# EAGLE design PWM Driver V2.2 (EAGLE 9.6.2)
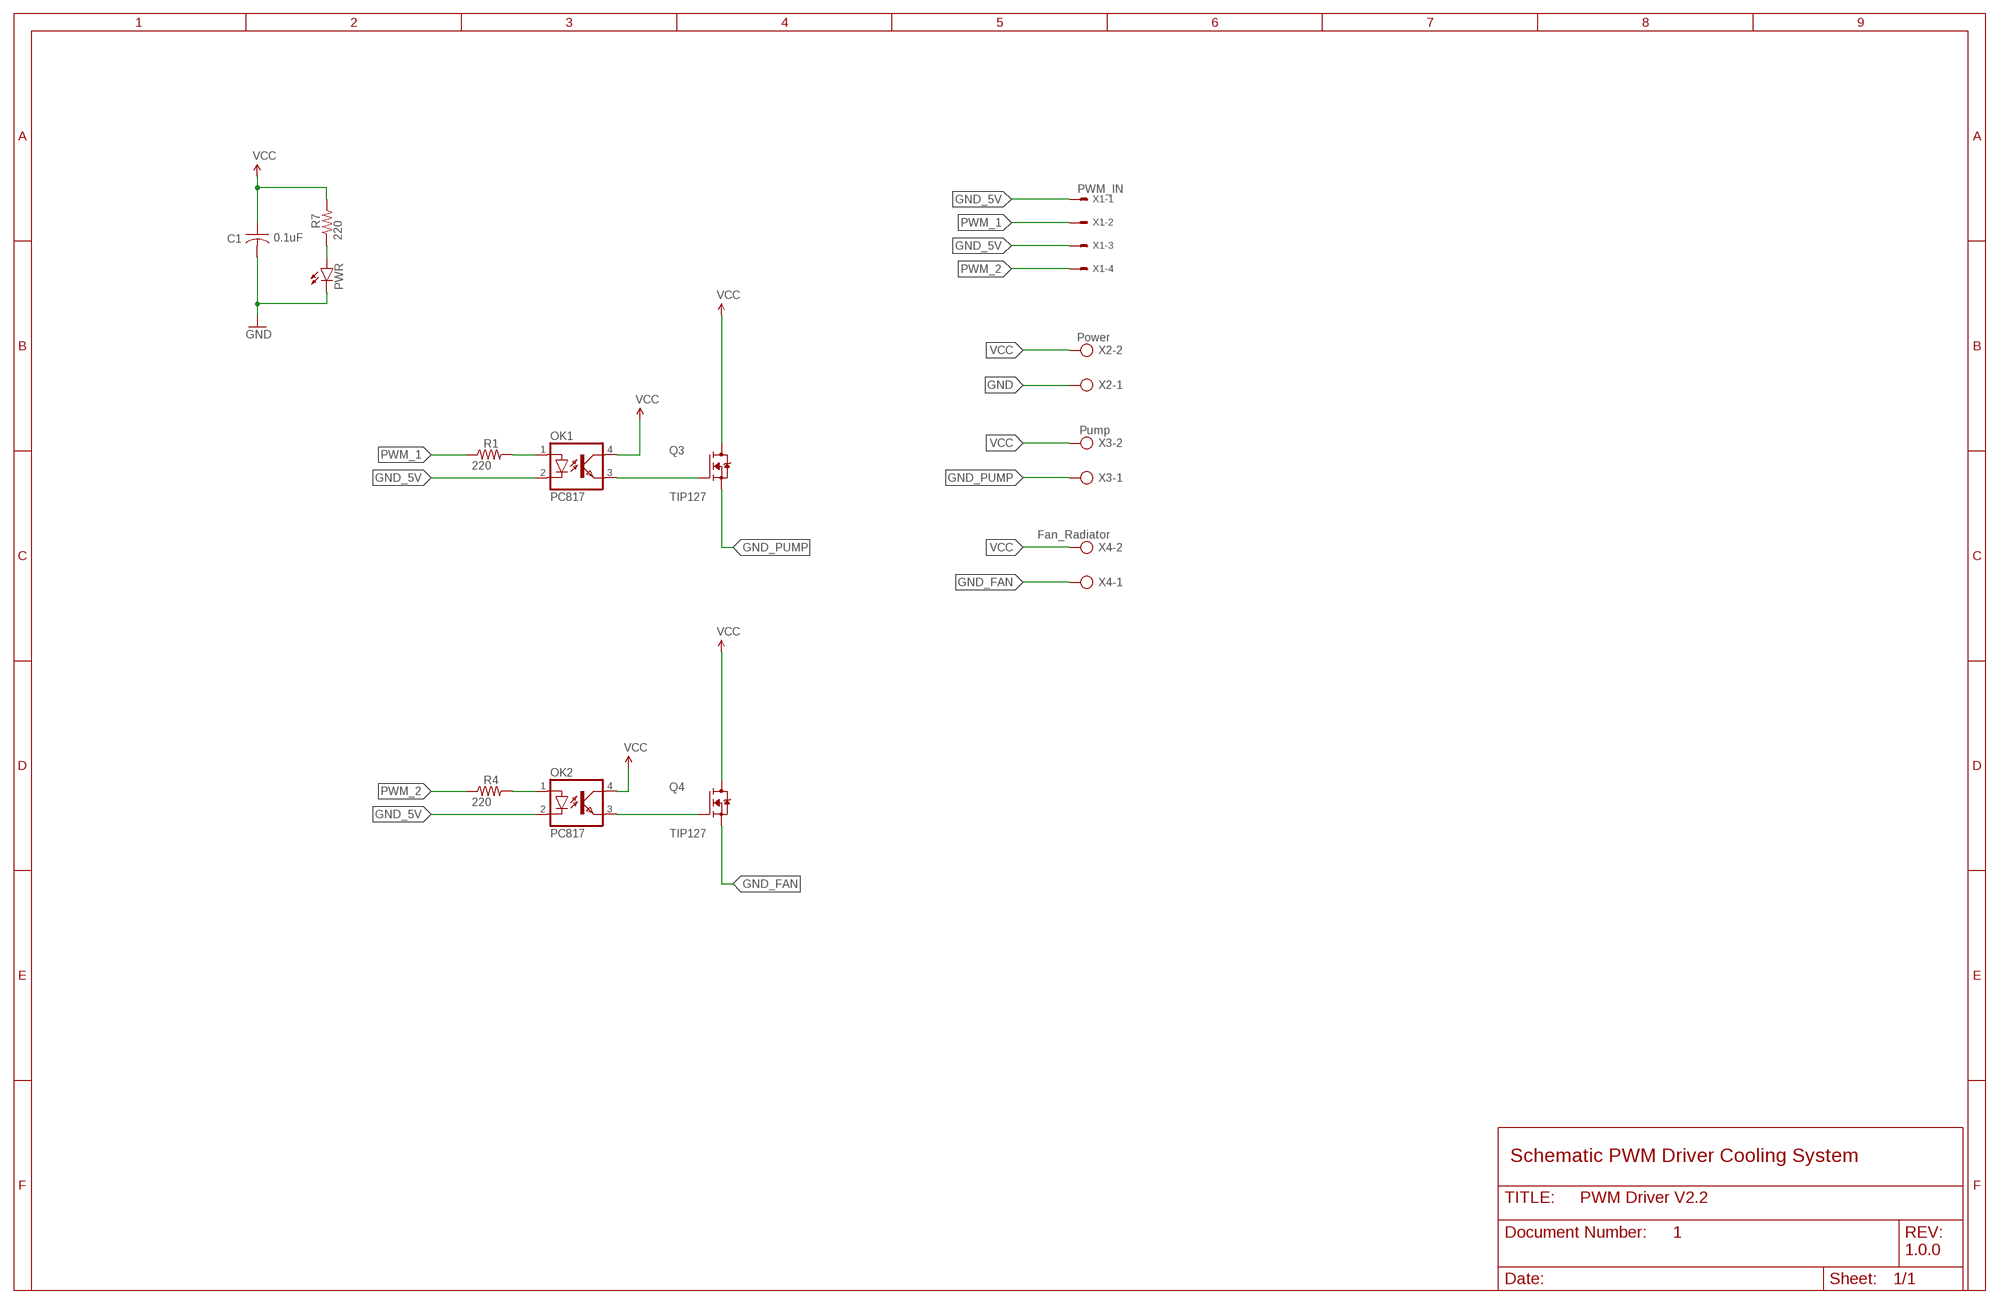
[diagram p0: schematic, sheet 1]
FRAME1 (FRAME_B_L): DESIGNER: PRATIK MAKWANA; DOC: 1; REV: 1.0.0

## Parts
C1  0.1uF  C-US050-030X075  [C050-030X075]
OK1  PC817  [DIL04]
OK2  PC817  [DIL04]
PWR  LED5MM  [LED5MM]
Q3  TIP127  IRF3205  [TO254P1041X444X2933-3]
Q4  TIP127  IRF3205  [TO254P1041X444X2933-3]
R1  220  R-US_0207/10  [0207/10]
R4  220  R-US_0207/10  [0207/10]
R7  220  R-US_0207/10  [0207/10]
X1  PWM_IN  22-23-2041  [22-23-2041]
X2  Power  AK500/2  [AK500/2]
X3  Pump  AK500/2  [AK500/2]
X4  Fan_Radiator  AK500/2  [AK500/2]

## Nets
GND: C1.2 PWR.K(C) X2.1
GND_5V: OK1.2(C) OK2.2(C) X1.1 X1.3
GND_FAN: Q4.3(S) X4.1
GND_PUMP: Q3.3(S) X3.1
N$1: OK2.1(A) R4.2
N$2: OK1.1(A) R1.2
N$3: OK2.3(EMIT) Q4.1(G)
N$4: OK1.3(EMIT) Q3.1(G)
N$6: PWR.A R7.1
PWM_1: R1.1 X1.2
PWM_2: R4.1 X1.4
VCC: C1.1 OK1.4(COL) OK2.4(COL) Q3.2(D) Q4.2(D) R7.2 X2.2 X3.2 X4.2

## Notes on the sheet
- Schematic PWM Driver Cooling System

## Library data of the parts
C1 = adafruit:C-US: CAPACITOR, American symbol
OK1 OK2 = optocoupler:PC817: SHARP OPTO COUPLER; MPN: PC817X4J000F; OC_FARNELL: 9707727; OC_NEWARK: 97K7059
PWR = led:LED: LED OSRAM: - CHIPLED LG R971, LG N971, LY N971, LG Q971, LY Q971, LO R971, LY R971 LH N974, LH R974 LS Q976, LO Q976, LY Q976 LO Q996 - Hyper CHIPLED LW Q18S LB Q993, LB Q99A, LB R99A - SideLED LS A670, LO A670, LY A670, LG A670, LP A670 LB A673, LV A673, LT A673, LW A673 LH A674 LY A675 LS A676, LA A676, LO A676, LY A676, LW A676 LS A679, LY A679, LG A679 - Hyper Micro SIDELED® LS Y876, LA Y876, LO Y876, LY Y876 LT Y87S - SmartLED LW L88C, LW L88S LB L89C, LB L89S, LG L890 LS L89K, LO L89K, LY L89K LS L896, LA L896, LO L896, LY L896 - TOPLED LS T670, LO T670, LY T670, LG T670, LP T670 LSG T670, LSP T670, LSY T670, LOP T670, LYG T670 LG T671, LOG T671, LSG T671 LB T673, LV T673, LT T673, LW T673 LH T674 LS T676, LA T676, LO T676, LY T676, LB T676, LH T676, LSB T676, LW T676 LB T67C, LV T67C, LT T67C, LS T67K, LO T67K, LY T67K, LW E67C LS E67B, LA E67B, LO E67B, LY E67B, LB E67C, LV E67C, LT E67C LW T67C LS T679, LY T679, LG T679 LS T770, LO T770, LY T770, LG T770, LP T770 LB T773, LV T773, LT T773, LW T773 LH T774 LS E675, LA E675, LY E675, LS T675 LS T776, LA T776, LO T776, LY T776, LB T776 LHGB T686 LT T68C, LB T68C - Hyper Mini TOPLED® LB M676 - Mini TOPLED Santana® LG M470 LS M47K, LO M47K, LY M47K Source: http://www.osram.convergy.de LUXEON: - LUMILED® LXK2-PW12-R00, LXK2-PW12-S00, LXK2-PW14-U00, LXK2-PW14-V00 LXK2-PM12-R00, LXK2-PM12-S00, LXK2-PM14-U00 LXK2-PE12-Q00, LXK2-PE12-R00, LXK2-PE12-S00, LXK2-PE14-T00, LXK2-PE14-U00 LXK2-PB12-K00, LXK2-PB12-L00, LXK2-PB12-M00, LXK2-PB14-N00, LXK2-PB14-P00, LXK2-PB14-Q00 LXK2-PR12-L00, LXK2-PR12-M00, LXK2-PR14-Q00, LXK2-PR14-R00 LXK2-PD12-Q00, LXK2-PD12-R00, LXK2-PD12-S00 LXK2-PH12-R00, LXK2-PH12-S00 LXK2-PL12-P00, LXK2-PL12-Q00, LXK2-PL12-R00 Source: www.luxeon.com KINGBRIGHT: KA-3528ASYC Source: www.kingbright.com
Q3 Q4 = IRF3205:IRF3205: N-Channel 55V 75A (Tc) 170W (Tc) Through Hole TO-220AB Check availability <https://pricing.snapeda.com/parts/IRF3205/Infineon%20Technologies/view-part?ref=eda>; AVAILABILITY: In Stock; CHECK_PRICES: https://www.snapeda.com/parts/IRF3205/Infineon/view-part/?ref=eda; DESCRIPTION: N-Channel 55V 110A (Tc) 200W (Tc) Through Hole TO-220AB; MF: Infineon Technologies; MP: IRF3205; PACKAGE: TO-220 Infineon; PRICE: None; SNAPEDA_LINK: https://www.snapeda.com/parts/IRF3205/Infineon/view-part/?ref=snap
R1 R4 R7 = adafruit:R-US_: RESISTOR, American symbol
X1 = con-molex:22-23-2041: .100" (2.54mm) Center Header - 4 Pin; MF: MOLEX; MPN: 22-23-2041; OC_FARNELL: 1462920; OC_NEWARK: 38C0355
X2-X4 = con-ptr500:AK500/2: CONNECTOR; OC_FARNELL: unknown; OC_NEWARK: unknown

## Board
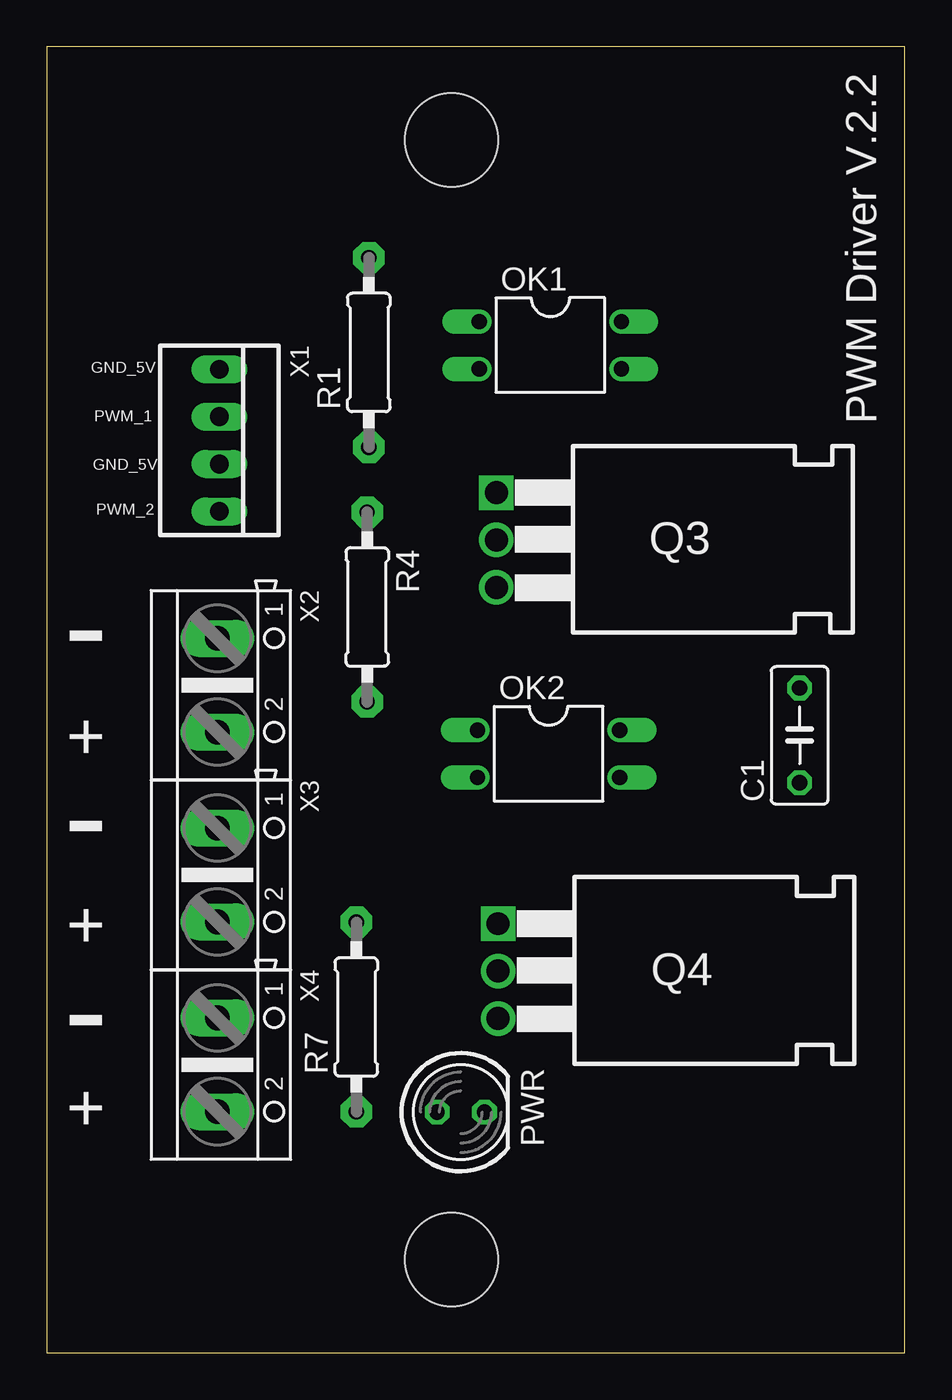
[diagram p1: board, top side]
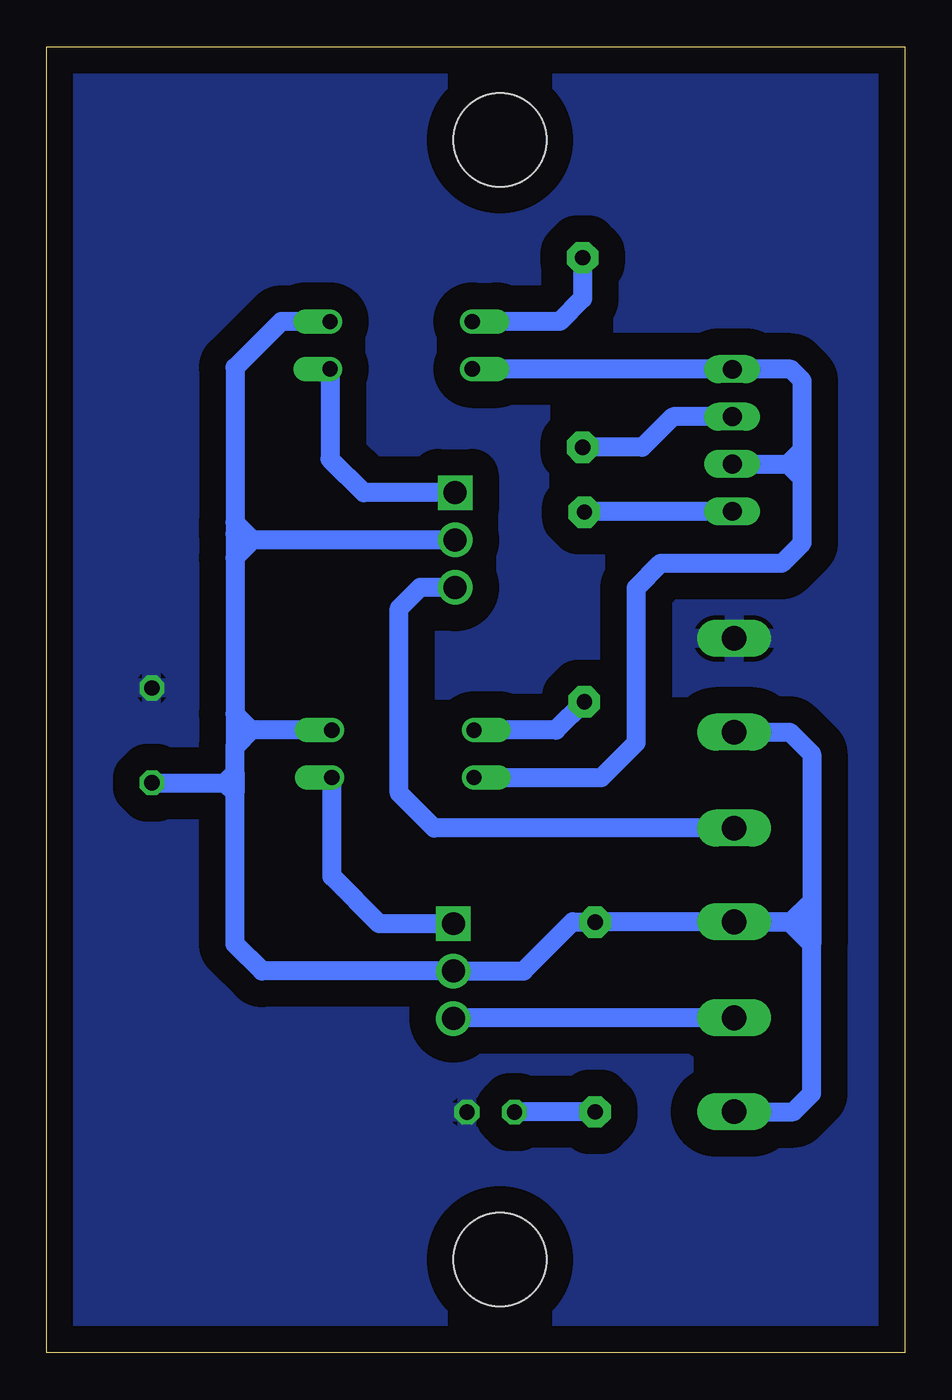
[diagram p2: board, bottom side, seen from below]

Size 46 x 70 mm. Coordinates in mm from the lower left corner, seen from the top.
Outline: 0,0 46,0 46,70 0,70 0,0
Copper layers (1*16): Top 0.035mm / dielectric 1.5mm / Bottom 0.035mm
Design rules "default": minimum track width 6mil, minimum drill 0.35mm, track to track 6mil, track to pad 6mil, pad to pad 6mil, via to via 6mil, smd to smd 6mil, copper to edge 40mil, drill to drill 6mil, minimum pad ring 10mil, minimum via ring 8mil, stop-mask expansion 4mil, vias tented up to drill 0mil, thermal gap 10mil
Holes 5 mm at 21.7,65 21.7,5

### Footprints (pad centres in the part's own frame; a part is rotated, then mirrored left to right if it is on the bottom)
C050-030X075 = drill 0.813 octagon: 1 -2.54,0; 2 2.54,0
DIL04 = drill 0.813 offset: 1 -1.27,-3.81; 2 1.27,-3.81; 3 1.27,3.81; 4 -1.27,3.81
LED5MM = drill 0.813 octagon: A -1.27,0; K 1.27,0
TO254P1041X444X2933-3 = drill 1.23 pad 1.85 square: 1 2.5,-4.2 | drill 1.23 pad 1.85: 2 5.04,-4.2; 3 7.58,-4.2
0207/10 = drill 0.813 pad 1.676 octagon: 1 -5.08,0; 2 5.08,0
22-23-2041 = drill 1 long: 1 -3.81,0; 2 -1.27,0; 3 1.27,0; 4 3.81,0
AK500/2 = drill 1.321 long: 1 -2.515,0; 2 2.515,0

### Placement (x,y rotation side)
C1  40.36,33.09 90 top
OK1  27,54 270 top
OK2  26.9,32.1 270 top
PWR  22.2,12.9 0 top
Q3  28.3,48.6 270 top
Q4  28.4,25.5 270 top
R1  17.27,53.61 90 top
R4  17.18,39.97 270 top
R7  16.6,18 90 top
X1  9.25,48.9 270 top
X2  9.15,35.78 270 top
X3  9.15,25.61 270 top
X4  9.15,15.44 270 top

### Tracks (layer width: path | path; a pad name or v marks a point on that pad's centre or on a via)
GND
  pour Bottom (isolate 1.422): 0,70 46,70 46,0 0,0
GND_5V
  Bottom 1.016: X1.3 6.27,47.63 | 5.5,48.4 6.27,47.63 | 5.5,48.4 5.5,52.1 6.11,52.71 X1.1 23.17,52.71 OK1.2 | 5.5,46.86 5.5,43.4 6.6,42.3 13.1,42.3 14.4,41 14.4,32.7 16.27,30.83 OK2.2 | 5.5,46.86 5.5,48.4 | 6.27,47.63 5.5,46.86
GND_FAN
  Bottom 1.016: X4.1 24.16,17.95 Q4.3
GND_PUMP
  Bottom 1.016: Q3.3 25.98,41.02 27.1,39.9 27.1,30 25.23,28.12 X3.1
N$1
  Bottom 1.016: R4.2 18.7,33.37 OK2.1
N$2
  Bottom 1.016: R1.2 17.27,56.49 18.49,55.27 OK1.1
N$3
  Bottom 1.016: Q4.1 28.18,23 30.71,25.53 OK2.3
N$4
  Bottom 1.016: Q3.1 29,46.1 30.81,47.91 OK1.3
N$6
  Bottom 1.016: R7.1 20.91,12.92 PWR.A
PWM_1
  Bottom 1.016: R1.1 14.07,48.53 12.43,50.17 X1.2
PWM_2
  Bottom 1.016: X1.4 17.14,45.09 R4.1
VCC
  Bottom 1.016: X4.2 5.97,12.93 5,13.9 5,21.9 | X3.2 6.2,23.09 5,21.9 | X2.2 6.17,33.27 5,32.1 5,24.2 | 5,24.2 5,21.9 | X3.2 6.11,23.09 5,24.2 | X3.2 9.09,23.16 | 35.9,43.9 35.9,42.62 | 35.9,42.62 35.9,34.24 | 35.9,34.24 35.9,32.5 | 35.9,31.1 35.9,30 | 35.9,30 35.9,21.9 34.46,20.46 Q4.2 20.44,20.46 17.8,23.09 16.59,23.09 | OK2.4 35.03,33.37 | 35.03,33.37 35.9,32.5 | 35.03,33.37 35.9,34.24 | 35.9,43.9 35.84,43.96 | C1.1 36.45,30.55 | 36.45,30.55 35.9,30 | 36.45,30.55 35.9,31.1 | 35.9,31.1 35.9,32.5 | OK1.4 33.43,55.27 35.9,52.8 35.9,44.5 | 35.9,44.5 35.9,43.9 | Q3.2 34.96,43.56 | 34.96,43.56 35.9,44.5 | 34.96,43.56 35.9,42.62 | X3.2 16.59,23.09 | 16.59,23.09 R7.2

### Text on the board
tPlace: PWM Driver V.2.2
tNames: GND_5V | PWM_1 | GND_5V | PWM_2 | - | + | - | + | - | +